# Altium schematic sheet CH32L103K8U-R0.SchDoc
size 304 x 254 mm
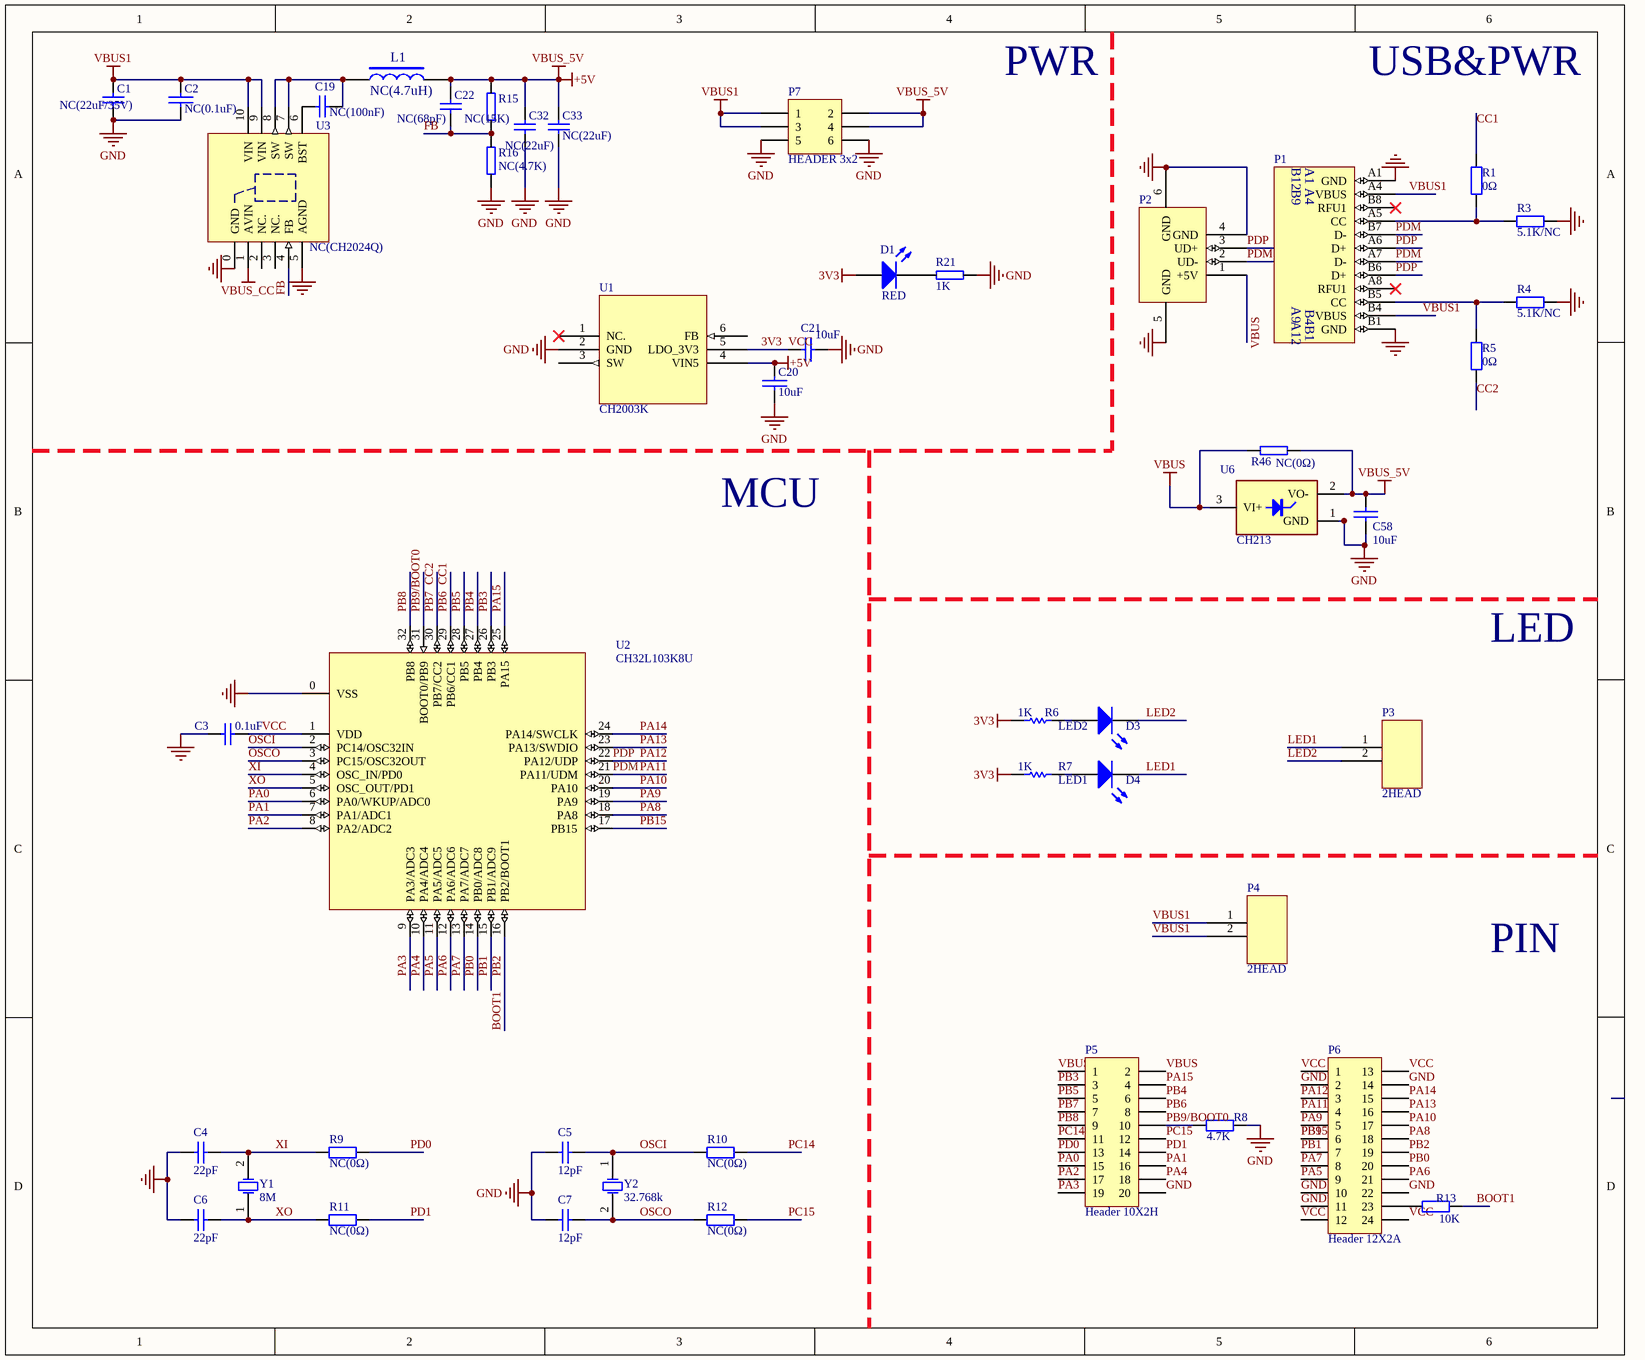
[diagram p0: CH32L103K8U-R0.SchDoc]

## Parts
C1  NC(22uF/35V)  [0805_C]
C2  NC(0.1uF)  [0402_C]
C3  0.1uF  [0603_C]
C4  22pF  [0603_C]
C5  12pF  [0603]
C6  22pF  [0603_C]
C7  12pF  [0603]
C19  NC(100nF)  [0402_C]
C20  10uF  [0603_C]
C21  10uF  [0603_C]
C22  NC(68pF)  [0402_C]
C32  NC(22uF)  [0805_C]
C33  NC(22uF)  [0805_C]
C58  10uF  [0603_C]
D1  RED  [0603+]
D3  LED2  [0603+]
D4  LED1  [0603+]
L1  NC(4.7uH)  [IND-SMD_L7.0-W6.6]
P1  TYPE-C  [TYPE-C-Receptacle-2.0]  (value not drawn)
P2  USB_A  [USBAF]  (value not drawn)
P3  2HEAD  [SIP2-2.54mm]
P4  2HEAD  [SIP2-2.54mm]
P5  Header 10X2H  [HDR2X10H]
P6  Header 12X2A  [HDR2X12_CEN]
P7  HEADER 3x2  [IDC6-2.54mm]
R1  0Ω  [0603]
R3  5.1K/NC  [0603]
R4  5.1K/NC  [0603]
R5  0Ω  [0603]
R6  1K  [0603]
R7  1K  [0603]
R8  4.7K  [0603]
R9  NC(0Ω)  [0603]
R10  NC(0Ω)  [0603]
R11  NC(0Ω)  [0603]
R12  NC(0Ω)  [0603]
R13  10K  [0603]
R15  NC(15K)  [0402]
R16  NC(4.7K)  [0402]
R21  1K  [0402]
R46  NC(0Ω)  [0402]
U1  CH2003K  [SOT-23-6]
U2  CH32L103K8U  [QFN32_4X4]
U3  NC(CH2024Q)  [DFN10_3X3]
U6  CH213  [SOT-23-3]
Y1  8M  [XT_AT49]
Y2  32.768k  [FC-135]

## Nets
3V3: C3.1 C21.2 D1.1(A) P6.1 P6.12 P6.13 P6.24 R6.1 R7.1 U1.5(LDO_3V3) U2.1(VDD)  [also labelled VCC]
+5V: C20.2 C22.1 C32.2 C33.2 C58.1 L1.2 P7.2 P7.4 R15.2 R46.1 U1.4(VIN5) U6.2(VO-)  [also labelled VBUS_5V]
GND: C1.1 C2.1 C3.2 C4.1 C5.2 C6.1 C7.2 C20.1 C21.1 C32.1 C33.1 C58.2 P1.A1(GND) P1.B1(GND) P2.4(GND) P2.5(GND) P2.6(GND) P5.20 P6.2 P6.10 P6.11 P6.14 P6.22 P7.5 P7.6 R3.2 R4.2 R8.2 R16.1 R21.2 U1.2(GND) U2.0(VSS) U3.0(GND) U3.5(AGND) U6.1(GND)
VBUS: P2.1(+5V) P5.1 P5.2 R46.2 U6.3(VI+)
VBUS1: C1.2 C2.2 P1.A4(VBUS) P1.B4(VBUS) P4.1 P4.2 P7.1 P7.3 U3.9(VIN) U3.10(VIN)
VBUS_CC: U3.1(AVIN)
BOOT1: P6.19 R13.2 U2.16(PB2/BOOT1)  [also labelled PB2]
CC1: P5.8 R1.2 U2.29(PB6/CC1)  [also labelled PB6]
CC2: P5.7 R5.1 U2.30(PB7/CC2)  [also labelled PB7]
FB: C22.2 R15.1 R16.2 U3.4(FB)
LED1: D4.2(K) P3.1
LED2: D3.2(K) P3.2
OSCI: C5.1 R10.2 U2.2(PC14/OSC32IN) Y2.1(OSC1)
OSCO: C7.1 R12.2 U2.3(PC15/OSC32OUT) Y2.2(OSC2)
PA0: P5.15 U2.6(PA0/WKUP/ADC0)
PA1: P5.16 U2.7(PA1/ADC1)
PA2: P5.17 U2.8(PA2/ADC2)
PA3: P5.19 U2.9(PA3/ADC3)
PA4: P5.18 U2.10(PA4/ADC4)
PA5: P6.9 U2.11(PA5/ADC5)
PA6: P6.21 U2.12(PA6/ADC6)
PA7: P6.8 U2.13(PA7/ADC7)
PA8: P6.18 U2.18(PA8)
PA9: P6.5 U2.19(PA9)
PA10: P6.17 U2.20(PA10)
PA11: P1.A7(D-) P1.B7(D-) P2.2(UD-) P6.4 U2.21(PA11/UDM)  [also labelled PDM]
PA12: P1.A6(D+) P1.B6(D+) P2.3(UD+) P6.3 U2.22(PA12/UDP)  [also labelled PDP]
PA13: P6.16 U2.23(PA13/SWDIO)
PA14: P6.15 U2.24(PA14/SWCLK)
PA15: P5.4 U2.25(PA15)
PB0: P6.20 U2.14(PB0/ADC8)
PB1: P6.7 U2.15(PB1/ADC9)
PB3: P5.3 U2.26(PB3)
PB4: P5.6 U2.27(PB4)
PB5: P5.5 U2.28(PB5)
PB8: P5.9 U2.32(PB8)
PB9/BOOT0: P5.10 R8.1 U2.31(BOOT0/PB9)
PB15: P6.6 U2.17(PB15)  [also labelled PB9]
PC14: P5.11 R10.1
PC15: P5.12 R12.1
PD0: P5.13 R9.1
PD1: P5.14 R11.1
XI: C4.2 R9.2 U2.4(OSC_IN/PD0) Y1.2(OSC2)
XO: C6.2 R11.2 U2.5(OSC_OUT/PD1) Y1.1(OSC1)
NetC19_1: C19.1 U3.6(BST)
NetC19_2: C19.2 L1.1 U3.7(SW) U3.8(SW)
NetD1_2: D1.2(K) R21.1
NetD3_1: D3.1(A) R6.2
NetD4_1: D4.1(A) R7.2
NetP1_A5: P1.A5(CC) R1.1 R3.1
NetP1_B5: P1.B5(CC) R4.1 R5.2
NetP6_23: P6.23 R13.1

Not connected (* = marked no-connect by the designer): P1 A8(RFU1)* B8(RFU1)*; U1 1(NC.)* 3(SW) 6(FB); U3 2(NC.) 3(NC.)

## Notes on the sheet
- PWR
- USB&PWR
- MCU
- LED
- PIN
- (in symbol TYPE-C1) B12; B9; A9; A12

## Library data of the parts
C1 C22 C32 C33 = 0603 100nF (104) 10% 50V: 贴片电容; ComponentLink1Description: 供应商链接; ComponentLink1URL: http://www.szlcsc.com/product/details_15331.html; Package: 0603; Supplier: LC; SuppliersPartNumber: C14663
C2 C20 C21 C58 = CAP: Capacitor
C3-C7 = Cap: Capacitor; Published: 8-Jun-2000; LatestRevisionDate: 17-Jul-2002; LatestRevisionNote: Re-released for DXP Platform.; PackageReference: RAD-0.3; Publisher: Altium Limited
C19 = 0603 1uF (105) 10% 50V: 贴片电容; ComponentLink1Description: 供应商链接; ComponentLink1URL: http://www.szlcsc.com/product/details_16531.html; Package: 0603; Supplier: LC; SuppliersPartNumber: C15849
D1 D3 D4 = LED0: Typical INFRARED GaAs LED; Published: 8-Jun-2000; LatestRevisionDate: 08-Jul-2005; LatestRevisionNote: Mech Layer 1 removed.; PackageReference: LED-0; Publisher: Altium Limited
  D1: PackageDescription: LED; 2 Leads
L1 = INDUCTOR
P1 = TYPE-C1
P2 = USB: USB Port
P5 = Header 10X2H: Header, 10-Pin, Dual row, Right Angle; LatestRevisionDate: 17-Jul-2002; LatestRevisionNote: Re-released for DXP Platform.; Publisher: Altium Limited
P6 = Header 12X2A: Header, 12-Pin, Dual row; LatestRevisionDate: 17-Jul-2002; LatestRevisionNote: Re-released for DXP Platform.; Publisher: Altium Limited
P7 = HEADER 3x2: Header, 3-Pin, Dual row
R1 R3-R5 R8-R13 = Res2: Resistor
  R13: Published: 8-Jun-2000; LatestRevisionDate: 17-Jul-2002; LatestRevisionNote: Re-released for DXP Platform.; PackageReference: AXIAL-0.4; Publisher: Altium Limited; Value: 10K
R6 R7 = Res Semi: Semiconductor Resistor
R15 R16 R21 R46 = RES
U1 = CH2003K: Step-Down DC-DC Converter, 5V input, FB 0.6V, 800mA output, with LDO 3.3V * 200mA
U2 = CH32L103K8U: RISC-V LMD-MCU, 96MHz, USB, Type-C/PD-5K1, CAN, OPA, lower power
U3 = CH2024Q: Step-Down DC-DC Converter, 28V input, FB 1.2V, 3A output
U6 = CH213E: Ideal Diode 5V*1A
Y1 Y2 = XTAL: Crystal Oscillator; Published: 8-Jun-2000; LatestRevisionDate: 17-Jul-2002; LatestRevisionNote: Re-released for DXP Platform.; PackageReference: R38; Publisher: Altium Limited